# Altium schematic sheet POE_PMUX.SchDoc
size A4; DocumentNumber: 12; SheetNumber: 12; SheetTotal: 12
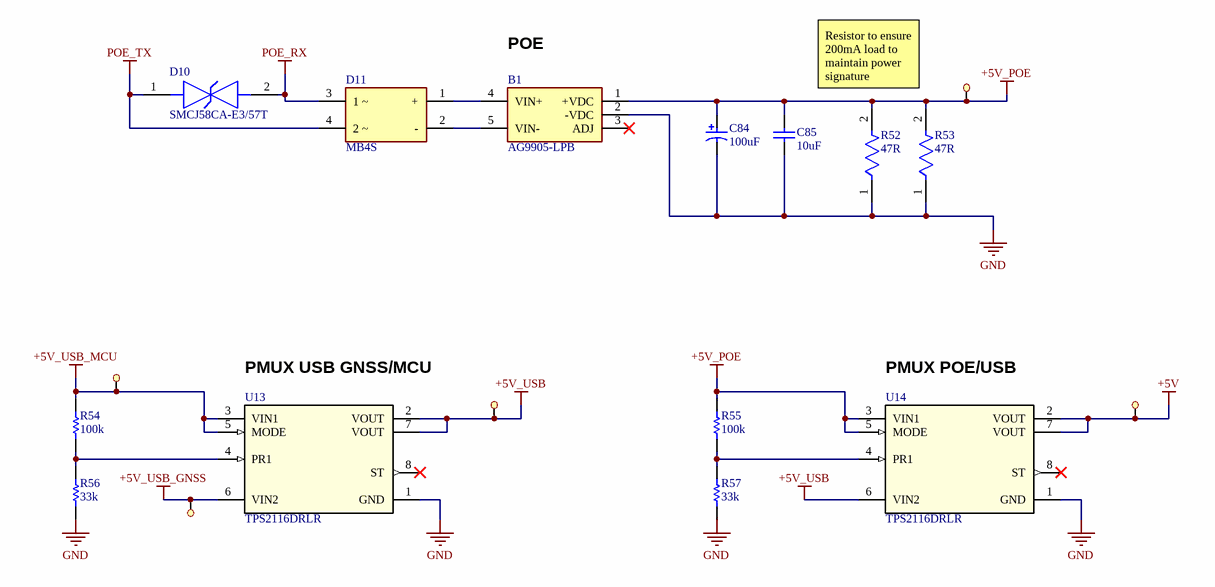
[diagram p0: POE_PMUX.SchDoc]

## Parts
*25  testpoint  [testpoint]  (value not drawn)
*26  testpoint  [testpoint]  (value not drawn)
*27  testpoint  [testpoint]  (value not drawn)
*28  testpoint  [testpoint]  (value not drawn)
*29  testpoint  [testpoint]  (value not drawn)
B1  AG9905-LPB  [AG9905MTB]
C84  100uF  [NIC-CAPA2-6.3X7.7_V]
C85  10uF  [FP-GRM188-0_2-IPC_C]
D10  SMCJ58CA-E3/57T  [FP-95402-MFG]
D11  MB4S  [FP-751EP-MFG]
R52  47R  [FP-RMCF2512-MFG]
R53  47R  [FP-RMCF2512-MFG]
R54  100k  [RESC0603(1608)_N]
R55  100k  [RESC0603(1608)_N]
R56  33k  [RESC3116X65X40LL10T20]
R57  33k  [RESC3116X65X40LL10T20]
U13  TPS2116DRLR  [DRL0008A-MFG]
U14  TPS2116DRLR  [DRL0008A-MFG]

## Nets
+5V: *28.1 U14.2(VOUT) U14.7(VOUT)
+5V_POE: *25.1 B1.1(+VDC) C84.1 C85.2 R52.2 R53.2 R55.1 U14.3(VIN1) U14.5(MODE)
+5V_USB: *27.1 U13.2(VOUT) U13.7(VOUT) U14.6(VIN2)
+5V_USB_GNSS: *29.1 U13.6(VIN2)
+5V_USB_MCU: *26.1 R54.1 U13.3(VIN1) U13.5(MODE)
GND: B1.2(-VDC) C84.2 C85.1 R52.1 R53.1 R56.2 R57.2 U13.1(GND) U14.1(GND)
POE_RX: D10.2 D11.3(1_~)
POE_TX: D10.1 D11.4(2_~)
NetB1_4: B1.4(VIN+) D11.1(+)
NetB1_5: B1.5(VIN-) D11.2(-)
NetR54_2: R54.2 R56.1 U13.4(PR1)
NetR55_2: R55.2 R57.1 U14.4(PR1)

Not connected (* = marked no-connect by the designer): B1 3(ADJ)*; U13 8(ST)*; U14 8(ST)*

## Notes on the sheet
- (near B1) POE
- Resistor to ensure 200mA load to maintain power signature
- (near U13) PMUX USB GNSS/MCU
- (near U14) PMUX POE/USB
- Project:
- Drawing number:
- Date:
- 1
- Rev:
- Format:
- A4
- Laboratory:
- Drawn by:
- Sheet:
- Page:
- of
- File:

## Library data of the parts
B1 = AG9905-MTB: Power over Ethernet - PoE PD Module, Isolated DC-DC converter, IEEE802.3af compliant, Over Temp. Protection, Ind Temp. Range, Small Footprint, SMT. (Blocks not pins).; Manufacturer Name: Silvertel; Geometry.Height: 13.05mm; Manufacturer Part Number: AG9905-LPB; Mouser Part Number: 480-AG9905-LPB; Mouser Price/Stock: https://www.mouser.co.uk/ProductDetail/Silvertel/AG9905-MTB?qs=vvQtp7zwQdPQM58WrfW9tQ%3D%3D; Arrow Part Number: *; Arrow Price/Stock: *; Datasheet Link: https://www.silvertel.com/images/datasheets/Ag9900M-datasheet-ultra-miniature-isolated-Power-over-Ethernet-POE-module.pdf
C84 = CMP-0687-00063-1: Aluminum Electrolytic Capacitor, UD Series, Low Impedance, 100 uF, 25 V, + / - 20%, -55 to 105 degC, Chip Type, 6.3 x 7.7 mm D x L, Pb-Free, Reel; PartNumber: UUD1E101MCL1GS; Manufacturer: Nichicon; Rated Ripple Current (at 100kHz): 280 mA; Endurance Time: 2000 h; Rated Voltage: 25 V; Packing: Dia382mm Reel; Tolerance Rated Capacitance: -20 to 20%; Impedance: 0.34 Ohm; PackageReference: CAPAE-D6.3H7.7; RoHS: TRUE; PackageDescription: 2-Pin Surface Mount Device, Diameter 6.3 mm, Height 7.7 mm, Pitch 5.4 mm; Mounting Technology: Surface Mount; ComponentLink3Description: Package Specification; Diameter: 6.3 mm; DatasheetVersion: 08/2012; ComponentLink3URL: http://products.nichicon.co.jp/en/pdf/XJA043/e-ud.pdf; Length: 7.7 mm; ComponentLink2Description: Datasheet; ComponentLink2URL: http://products.nichicon.co.jp/en/pdf/XJA043/e-ud.pdf; Rated Capacitance: 100 uF; ComponentLink1Description: Manufacturer URL; ComponentLink1URL: http://www.nichicon.co.jp/
C85 = GRM188R61E106MA73D: CAP CER 10UF 25V X5R 0603; Manufacturer: Murata; Tolerance: 20%; Supplier: Digi-Key; Supplier Part Number: 490-7202-6-ND; Manufacturer Part Number: GRM188R61E106MA73D; RoHS: Yes; Category: Ceramic Capacitors; Stock: 3353344; Pricing: 1=0.26, 10=0.176, 50=0.1176, 100=0.0999, 500=0.07054, 1000=0.06173 (USD); ComponentLink1URL: https://datasheet.ciiva.com/14906/partnumbering-e-01-14906429.pdf?src-supplier=Digi-Key; ComponentLink1Description: https://datasheet.ciiva.com/14906/partnumbering-e-01-14906429.pdf?src-supplier=Digi-Key; ComponentLink2URL: https://datasheet.ciiva.com/14906/partnumbering-e-01-14906431.pdf?src-supplier=Digi-Key; ComponentLink2Description: https://datasheet.ciiva.com/14906/partnumbering-e-01-14906431.pdf?src-supplier=Digi-Key; ComponentLink3URL: https://datasheet.ciiva.com/22776/608985-22776426.pdf?src-supplier=Farnell; ComponentLink3Description: https://datasheet.ciiva.com/22776/608985-22776426.pdf?src-supplier=Farnell; ComponentLink4URL: https://datasheet.ciiva.com/22776/c02e-22776427.pdf?src-supplier=Farnell; ComponentLink4Description: https://datasheet.ciiva.com/22776/c02e-22776427.pdf?src-supplier=Farnell; ComponentLink5URL: https://datasheet.ciiva.com/22619/c02e-22619674.pdf?src-supplier=Element14; ComponentLink5Description: https://datasheet.ciiva.com/22619/c02e-22619674.pdf?src-supplier=Element14; Value: 10uF
D10 = CMP-02577-000016-1: TVS DIODE 58V 93.6V DO214AB; Manufacturer: Vishay Semiconductor Diodes Division; Standoff Height: 0mm; Peak Pulse Power: 1500W; Direction: Bidirectional; Automotive Grade: NA; Peak Pulse Current: 16A; Max Junction Temp: +150°C; Breakdown Voltage: 64.4V; Number Of Channels: 1; Temperature Range Low: -55°C; Mouser Description: TVS Diodes - Transient Voltage Suppressors 1500W 58V Bidirect; ComponentLink2URL: https://www.vishay.com/docs/88394/smcj.pdf; Height: 2.62mm; Octopart: https://octopart.com/smcj58ca-e3%2F57t-vishay-39599086; Temperature: -55°C to +150°C; Clamping Voltage: 93.6V; Device Class L1: Circuit Protection; Category: Diode; Automotive: No; Manufacturer Part Number: SMCJ58CA-E3/57T; ComponentLink2Description: Datasheet; Lead Free: Yes; Package: 95402; Temperature Range High: +150°C; Device Class L2: TVS Diodes; Device Class L3: unset; RoHS: TRUE; Footprint Url: http://www.vishay.com/docs/95402/smc.pdf; Digikey Description: TVS DIODE 58V 93.6V DO214AB; Reverse Standoff Voltage: 58V
D11 = CMP-07163-000033-1: BRIDGE RECT 1P 400V 500MA 4SOIC; Manufacturer: ON Semiconductor; Value: 13pF; Forward Current: 0.5A; Standoff Height: 0.05mm; Max Junction Temp: +150°C; Peak Reverse Current: 5uA; Max Surge Forward Current: 35A; Category: Diode; ComponentLink2Description: Datasheet; Max Repetitive Reverse Voltage: 400V; Device Class L1: Discrete Semiconductors; Mouser Description: Bridge Rectifiers 0.5A Bridge; Capacitance: 13pF; Lead Free: Yes; Device Class L2: Diodes; Height: 2.9mm; Temperature: -55°C to +150°C; Reverse Voltage: 400V; Manufacturer Part Number: MB4S; RoHS: TRUE; Temperature Range High: +150°C; Automotive: No; Package: 751EP; Octopart: https://octopart.com/mb4s-on+semiconductor-84329762; Temperature Range Low: -55°C; Ipc Land Pattern Name: SOIC254P670X265-4; Digikey Description: BRIDGE RECT 1P 400V 500MA 4SOIC; ComponentLink2URL: https://www.onsemi.com/pub/Collateral/MB8S-D.PDF; Device Class L3: Rectifier Diodes
R52 R53 = CMP-26527-006410-1: 47Ω ±5% 1W 2512 Thick Film Chip Resistor AEC-Q200 compliant; Manufacturer: Stackpole Electronics; Manufacturer Part Number: RMCF2512JT47R0; Temperature Coefficient: 200ppm/°C; Voltage Rating: 200V; Case Code (Metric): 6432; Tolerance: 5%; Power Rating: 1W; Number of Terminations: 2; Packaging: Tape and Reel; Min Operating Temperature: -55°C; Case Code (Imperial): 2512; Depth: 3.2mm; RoHS Compliant: Yes; Case/Package: 2512; Max Power Dissipation: 1W; Resistor Type: Thick Film; Military Standard: Not; Series: RMCF; Mount: Surface Mount; Features: Automotive AEC-Q200; Resistance: 47R; Contact Plating: Tin; Width: 0.126inch; Height: 0.028inch; Lead Free: Lead Free; Max Operating Temperature: 155°C; Length: 0.248inch; Construction: Rectangular; Radiation Hardening: No; Supplier: Avnet; Supplier Part Number: RMCF2512JT47R0; RoHS: Compliant; Category: Chip SMD Resistors; Stock: 96000; Pricing: 4000=0.03536, 8000=0.03484, 16000=0.03432, 32000=0.0338, 64000=0.03328 (USD); China RoHS: Non-Compliant; Composition: Thick Film; Country of Origin: Japan, Mainland China, Taiwan; Export Control Classification Number (ECCN) Code: EAR99; Harmonized Tariff Schedule (HTS) Code: 8533.21.00.30; Introduction Date: 2011-01-07; Lifecycle Status: Production; Mounting Technology: Surface Mount; Number of Terminals: 2; Ratings: AEC-Q200; REACH SVHC: Yes; Value: 47Ω; Schedule B: 8533210045, 8533210045|8533210045, 8533210045|8533210045|8533210045, 8533210045|8533210045|8533210045|8533210045; Working Voltage: 200V; ComponentLink1URL: https://datasheet.octopart.com:443/RMCF2512JT47R0-Stackpole-Electronics-datasheet-182148065.pdf?src-supplier=IHS; ComponentLink1Description: https://datasheet.octopart.com:443/RMCF2512JT47R0-Stackpole-Electronics-datasheet-182148065.pdf?src-supplier=IHS; ComponentLink2URL: https://datasheet.octopart.com:443/RMCF2512JT47R0-Stackpole-Electronics-datasheet-28504820.pdf?src-supplier=Upverter; ComponentLink2Description: https://datasheet.octopart.com:443/RMCF2512JT47R0-Stackpole-Electronics-datasheet-28504820.pdf?src-supplier=Upverter; ComponentLink3URL: https://datasheet.octopart.com:443/RMCF2512JT47R0-Stackpole-Electronics-datasheet-141193804.pdf?src-supplier=Master+Electronics; ComponentLink3Description: https://datasheet.octopart.com:443/RMCF2512JT47R0-Stackpole-Electronics-datasheet-141193804.pdf?src-supplier=Master+Electronics; ComponentLink4URL: https://datasheet.octopart.com:443/RMCF2512JT47R0-Stackpole-Electronics-datasheet-189104163.pdf?src-supplier=Master+Electronics; ComponentLink4Description: https://datasheet.octopart.com:443/RMCF2512JT47R0-Stackpole-Electronics-datasheet-189104163.pdf?src-supplier=Master+Electronics; ComponentLink5URL: https://datasheet.octopart.com:443/RMCF2512JT47R0-Stackpole-Electronics-datasheet-116606903.pdf?src-supplier=Master+Electronics; ComponentLink5Description: https://datasheet.octopart.com:443/RMCF2512JT47R0-Stackpole-Electronics-datasheet-116606903.pdf?src-supplier=Master+Electronics; ComponentLink6URL: https://datasheet.octopart.com:443/RMCF2512JT47R0-Stackpole-Electronics-datasheet-62091608.pdf?src-supplier=Stackpole+Electronics; ComponentLink6Description: https://datasheet.octopart.com:443/RMCF2512JT47R0-Stackpole-Electronics-datasheet-62091608.pdf?src-supplier=Stackpole+Electronics; ComponentLink7URL: https://datasheet.octopart.com:443/RMCF2512JT47R0-Stackpole-Electronics-datasheet-12534581.pdf?src-supplier=Stackpole+Electronics; ComponentLink7Description: https://datasheet.octopart.com:443/RMCF2512JT47R0-Stackpole-Electronics-datasheet-12534581.pdf?src-supplier=Stackpole+Electronics; ComponentLink8URL: https://datasheet.octopart.com:443/RMCF2512JT47R0-Stackpole-Electronics-datasheet-10788263.pdf?src-supplier=Stackpole+Electronics; ComponentLink8Description: https://datasheet.octopart.com:443/RMCF2512JT47R0-Stackpole-Electronics-datasheet-10788263.pdf?src-supplier=Stackpole+Electronics; ComponentLink9URL: https://datasheet.octopart.com:443/RMCF2512JT47R0-Stackpole-Electronics-datasheet-11547379.pdf?src-supplier=Future+Electronics; ComponentLink9Description: https://datasheet.octopart.com:443/RMCF2512JT47R0-Stackpole-Electronics-datasheet-11547379.pdf?src-supplier=Future+Electronics; ComponentLink10URL: https://datasheet.octopart.com:443/RMCF2512JT47R0-Stackpole-Electronics-datasheet-8359789.pdf?src-supplier=Future+Electronics; ComponentLink10Description: https://datasheet.octopart.com:443/RMCF2512JT47R0-Stackpole-Electronics-datasheet-8359789.pdf?src-supplier=Future+Electronics; ComponentLink11URL: https://datasheet.octopart.com:443/RMCF2512JT47R0-Stackpole-Electronics-datasheet-8324226.pdf?src-supplier=Future+Electronics; ComponentLink11Description: https://datasheet.octopart.com:443/RMCF2512JT47R0-Stackpole-Electronics-datasheet-8324226.pdf?src-supplier=Future+Electronics; ComponentLink12URL: https://datasheet.octopart.com:443/RMCF2512JT47R0-Stackpole-Electronics-datasheet-8088878.pdf?src-supplier=Future+Electronics; ComponentLink12Description: https://datasheet.octopart.com:443/RMCF2512JT47R0-Stackpole-Electronics-datasheet-8088878.pdf?src-supplier=Future+Electronics; ComponentLink13URL: https://datasheet.octopart.com:443/RMCF2512JT47R0-Stackpole-Electronics-datasheet-5313682.pdf?src-supplier=Future+Electronics; ComponentLink13Description: https://datasheet.octopart.com:443/RMCF2512JT47R0-Stackpole-Electronics-datasheet-5313682.pdf?src-supplier=Future+Electronics; ComponentLink14URL: http://sigma.octopart.com:80/15940719/materials_sheet/Stackpole-Electronics-RMCF2512JT47R0.pdf?src-supplier=Compliance+Statements; ComponentLink14Description: http://sigma.octopart.com:80/15940719/materials_sheet/Stackpole-Electronics-RMCF2512JT47R0.pdf?src-supplier=Compliance+Statements; ComponentLink15URL: http://sigma.octopart.com:80/141158211/reach_statement/Stackpole-Electronics-RMCF2512JT47R0.pdf?src-supplier=Compliance+Statements; ComponentLink15Description: http://sigma.octopart.com:80/141158211/reach_statement/Stackpole-Electronics-RMCF2512JT47R0.pdf?src-supplier=Compliance+Statements; ComponentLink16URL: http://sigma.octopart.com:80/141158212/rohs_statement/Stackpole-Electronics-RMCF2512JT47R0.pdf?src-supplier=Compliance+Statements; ComponentLink16Description: http://sigma.octopart.com:80/141158212/rohs_statement/Stackpole-Electronics-RMCF2512JT47R0.pdf?src-supplier=Compliance+Statements
R54 = CMP-1012-00736-1: 100K 0.1W 1% 0603 (1608 Metric)  SMD; Manufacturer: Vishay; Manufacturer Part Number: CRCW0603100KFKTC; Value: 100000.00 Ohm; Case-Metric: 1608; Case-EIA: 0603; Max Power Dissipation: 100mW; Temperature Coefficient: 100ppm/°C; Working Voltage: 75V; Power: 0.1 W; Tolerance: 1 %; Technology: SMT; Supplier: DigiKey; Supplier Part Number: CRCW0603100KFKTC-ND; Category: Chip SMD Resistors; Pricing: 20000=0.01889 (USD); Case/Package: 0603; Composition: Thick Film; Contact Plating: Lead, Tin; Features: Automotive AEC-Q200; Height: 450µm; Lead Free: Contains Lead; Length: 1.55mm; Lifecycle Status: Production; Max Operating Temperature: 155°C; Min Operating Temperature: -55°C; Mounting Technology: Surface Mount; Number of Terminals: 2; Number of Terminations: 2; Packaging: Tape & Reel; Power Rating: 100mW; Radiation Hardening: No; Ratings: AEC-Q200; REACH SVHC: No; RoHS: Non-Compliant; Width: 850µm; ComponentLink1URL: https://datasheet.octopart.com:443/CRCW0603100KFKTC-Vishay-datasheet-175863636.pdf?src-supplier=IHS; ComponentLink1Description: https://datasheet.octopart.com:443/CRCW0603100KFKTC-Vishay-datasheet-175863636.pdf?src-supplier=IHS; ComponentLink2URL: https://datasheet.octopart.com:443/CRCW0603100KFKTC-Vishay-datasheet-182027442.pdf?src-supplier=IHS; ComponentLink2Description: https://datasheet.octopart.com:443/CRCW0603100KFKTC-Vishay-datasheet-182027442.pdf?src-supplier=IHS; ComponentLink3URL: https://datasheet.octopart.com/D-CRCW-Lead-%28Pb%29-Bearing-Thick-Film%2C-Rectangular-Chip-Resistors-Vishay-datasheet-family-72.pdf; ComponentLink3Description: https://datasheet.octopart.com/D-CRCW-Lead-%28Pb%29-Bearing-Thick-Film%2C-Rectangular-Chip-Resistors-Vishay-datasheet-family-72.pdf; ComponentLink4URL: https://datasheet.octopart.com/CRCW0603100KFKTC-Vishay-datasheet-13242068.pdf; ComponentLink4Description: https://datasheet.octopart.com/CRCW0603100KFKTC-Vishay-datasheet-13242068.pdf; ComponentLink5URL: https://datasheet.octopart.com/CRCW0603100KFKTC-Vishay-datasheet-13195083.pdf; ComponentLink5Description: https://datasheet.octopart.com/CRCW0603100KFKTC-Vishay-datasheet-13195083.pdf; ComponentLink6URL: https://datasheet.octopart.com/CRCW0603100KFKTC-Vishay-datasheet-13034211.pdf; ComponentLink6Description: https://datasheet.octopart.com/CRCW0603100KFKTC-Vishay-datasheet-13034211.pdf; ComponentLink7URL: https://datasheet.octopart.com/CRCW0603100KFKTC-Vishay-datasheet-12600034.pdf; ComponentLink7Description: https://datasheet.octopart.com/CRCW0603100KFKTC-Vishay-datasheet-12600034.pdf; ComponentLink8URL: https://datasheet.octopart.com/CRCW0603100KFKTC-Vishay-datasheet-12532161.pdf; ComponentLink8Description: https://datasheet.octopart.com/CRCW0603100KFKTC-Vishay-datasheet-12532161.pdf; ComponentLink9URL: https://datasheet.octopart.com/CRCW0603100KFKTC-Vishay-datasheet-12517896.pdf; ComponentLink9Description: https://datasheet.octopart.com/CRCW0603100KFKTC-Vishay-datasheet-12517896.pdf; ComponentLink10URL: https://datasheet.octopart.com/CRCW0603100KFKTC-Vishay-datasheet-12509762.pdf; ComponentLink10Description: https://datasheet.octopart.com/CRCW0603100KFKTC-Vishay-datasheet-12509762.pdf; ComponentLink11URL: https://datasheet.octopart.com/CRCW0603100KFKTC-Vishay-datasheet-10322335.pdf; ComponentLink11Description: https://datasheet.octopart.com/CRCW0603100KFKTC-Vishay-datasheet-10322335.pdf; ComponentLink12URL: https://datasheet.octopart.com/CRCW0603100KFKTC-Vishay-datasheet-8788789.pdf; ComponentLink12Description: https://datasheet.octopart.com/CRCW0603100KFKTC-Vishay-datasheet-8788789.pdf; ComponentLink13URL: https://datasheet.octopart.com/CRCW0603100KFKTC-Vishay-datasheet-8361388.pdf; ComponentLink13Description: https://datasheet.octopart.com/CRCW0603100KFKTC-Vishay-datasheet-8361388.pdf; ComponentLink14URL: https://datasheet.octopart.com/CRCW0603100KFKTC-Vishay-datasheet-5306405.pdf; ComponentLink14Description: https://datasheet.octopart.com/CRCW0603100KFKTC-Vishay-datasheet-5306405.pdf; ComponentLink15URL: https://datasheet.octopart.com/CRCW0603100KFKTC-Vishay-datasheet-546287.pdf; ComponentLink15Description: https://datasheet.octopart.com/CRCW0603100KFKTC-Vishay-datasheet-546287.pdf; ComponentLink16URL: http://sigma.octopart.com:80/rohs_statement/Vishay-company-15.pdf?src-supplier=Compliance+Statements; ComponentLink16Description: http://sigma.octopart.com:80/rohs_statement/Vishay-company-15.pdf?src-supplier=Compliance+Statements
R55 = CMP-1012-00736-1: 100K 0.1W 1% 0603 (1608 Metric)  SMD; Value: 100000.00 Ohm; Case-Metric: 1608; Case-EIA: 0603; Power: 0.1 W; Tolerance: 1 %; Technology: SMT
R56 R57 = CMP-2003-03510-1: Part Number: RC1206JR-1033KL; Manufacturer: Yageo
U13 U14 = TPS2116DRLR: 1.6-V to 5.5-V, 40-mâ„¦, 2.5-A, low-IQ, priority power multiplexer 8-SOT-5X3 -40 to 125; Manufacturer Name: Texas Instruments; TYPE: TYPE; RefDes: RefDes; Copyright: Copyright (C) 2026 Ultra Librarian. All rights reserved.; Manufacturer Part Number: TPS2116DRLR